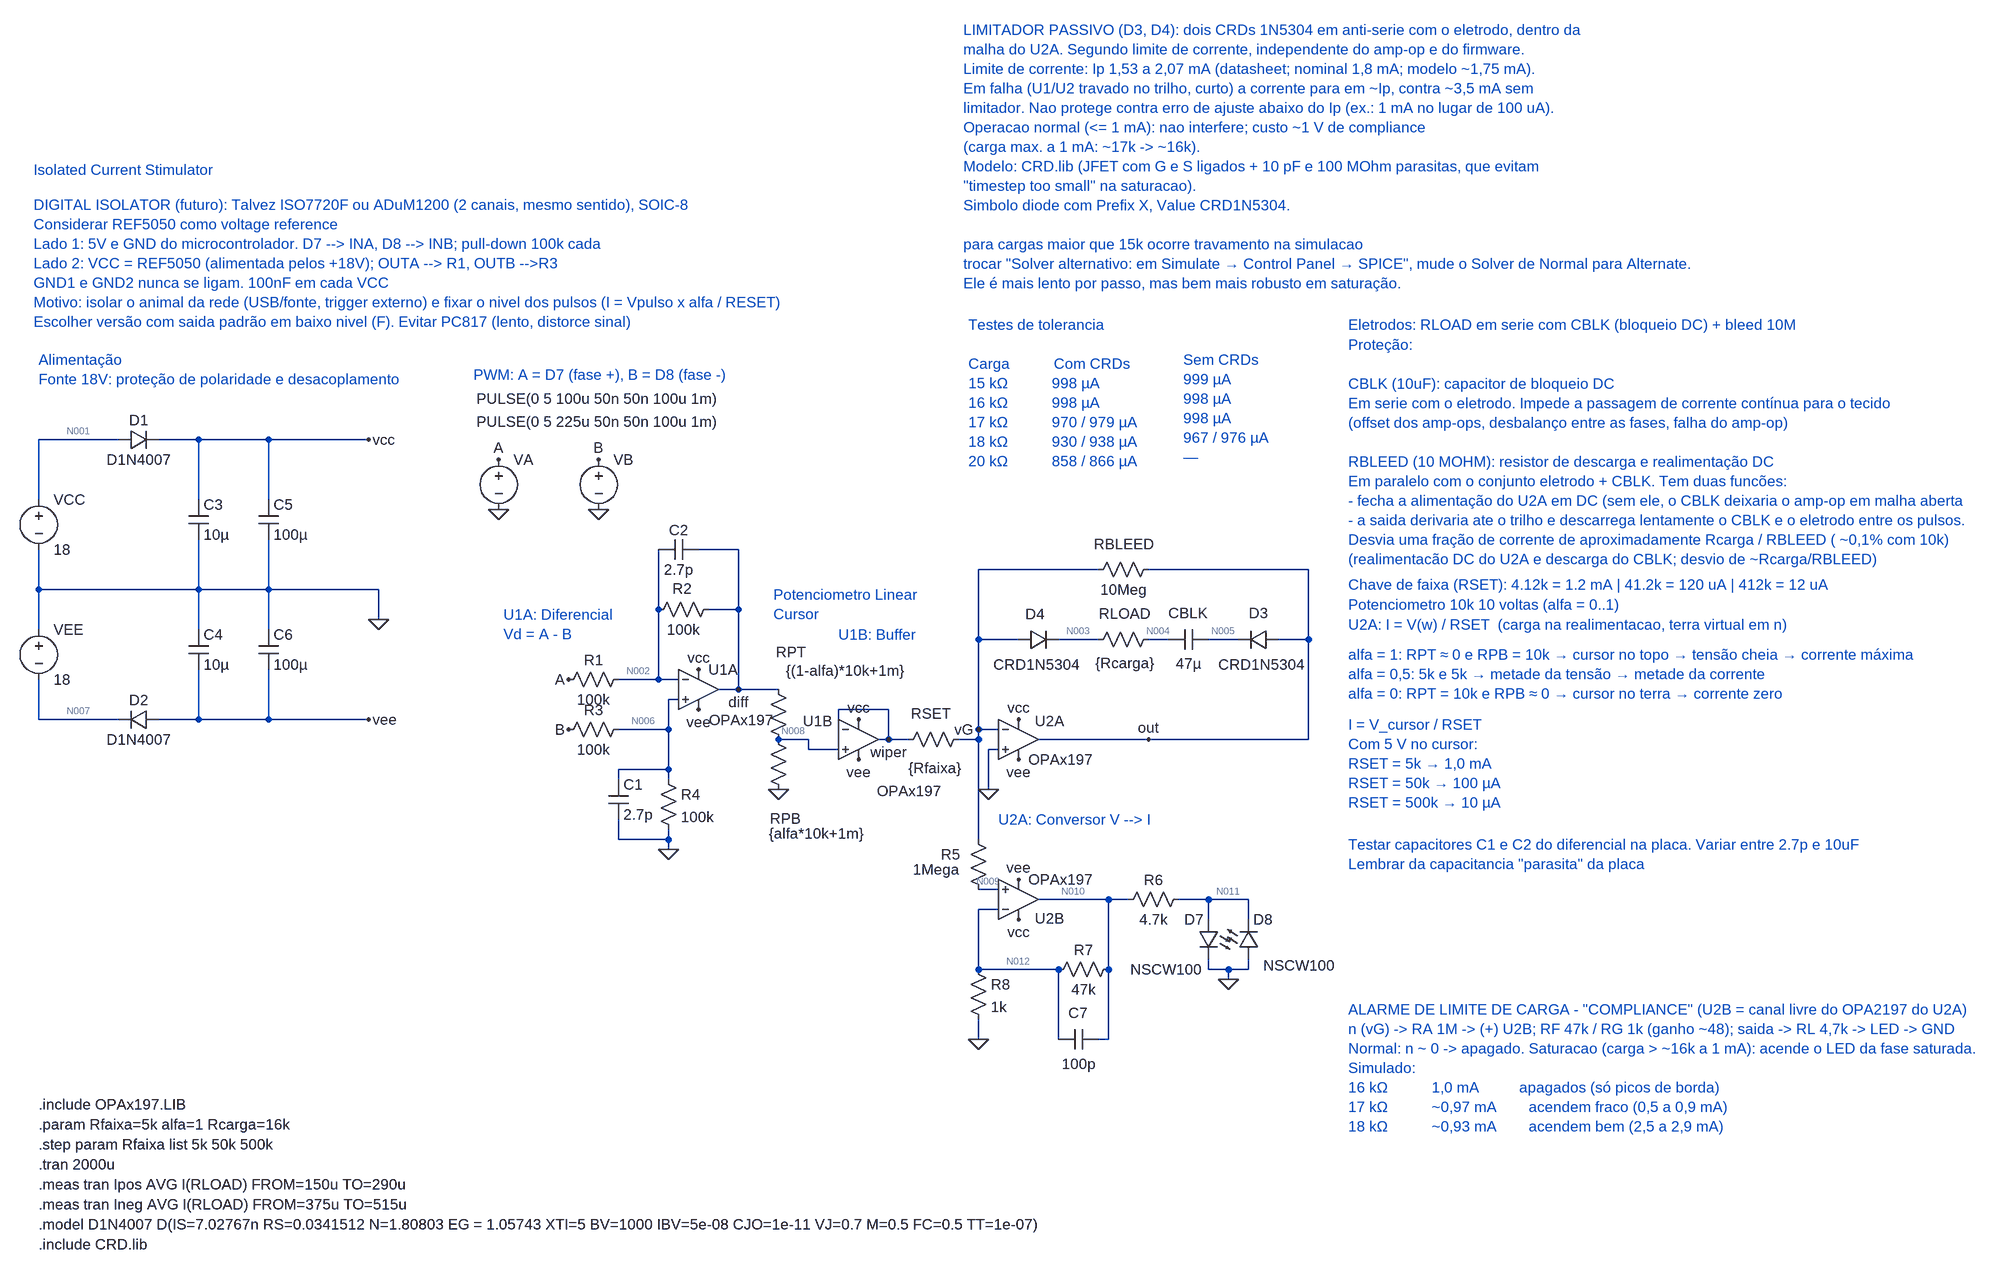
[diagram p0: schematic gila_stim_opax197_limit.asc]
gila_stim_opax197_limit.asc, the LTspice schematic file:
Version 4.1
SHEET 1 3020 1240
WIRE -944 -352 -1072 -352
WIRE -816 -352 -880 -352
WIRE -704 -352 -816 -352
WIRE -544 -352 -704 -352
WIRE -1072 -256 -1072 -352
WIRE -816 -256 -816 -352
WIRE -704 -256 -704 -352
WIRE 48 -176 -16 -176
WIRE 624 -144 432 -144
WIRE 960 -144 704 -144
WIRE -1072 -112 -1072 -176
WIRE -816 -112 -816 -192
WIRE -816 -112 -1072 -112
WIRE -704 -112 -704 -192
WIRE -704 -112 -816 -112
WIRE -528 -112 -704 -112
WIRE -80 -80 -80 -176
WIRE 48 -80 48 -176
WIRE 48 -80 0 -80
WIRE -528 -64 -528 -112
WIRE -1072 -48 -1072 -112
WIRE -816 -48 -816 -112
WIRE -704 -48 -704 -112
WIRE 432 -32 432 -144
WIRE 496 -32 432 -32
WIRE 624 -32 560 -32
WIRE 736 -32 704 -32
WIRE 848 -32 800 -32
WIRE 960 -32 960 -144
WIRE 960 -32 912 -32
WIRE -80 32 -80 -80
WIRE -80 32 -144 32
WIRE -48 32 -80 32
WIRE 48 48 48 -80
WIRE 48 48 16 48
WIRE 112 48 48 48
WIRE -48 64 -64 64
WIRE 288 80 208 80
WIRE -1072 96 -1072 32
WIRE -944 96 -1072 96
WIRE -816 96 -816 16
WIRE -816 96 -880 96
WIRE -704 96 -704 16
WIRE -704 96 -816 96
WIRE -544 96 -704 96
WIRE -64 112 -64 64
WIRE -64 112 -144 112
WIRE 208 112 208 80
WIRE 432 112 432 -32
WIRE 464 112 432 112
WIRE 160 128 112 128
WIRE 288 128 288 80
WIRE 288 128 272 128
WIRE 320 128 288 128
WIRE 432 128 432 112
WIRE 432 128 400 128
WIRE 704 128 528 128
WIRE 960 128 960 -32
WIRE 960 128 704 128
WIRE 160 144 160 128
WIRE 208 144 160 144
WIRE 464 144 448 144
WIRE -64 176 -64 112
WIRE -64 176 -144 176
WIRE -144 192 -144 176
WIRE -64 192 -64 176
WIRE 448 208 448 144
WIRE -144 288 -144 256
WIRE -64 288 -64 272
WIRE -64 288 -144 288
WIRE 432 288 432 128
WIRE -64 304 -64 288
WIRE 464 368 432 368
WIRE 640 384 528 384
WIRE 672 384 640 384
WIRE 800 384 752 384
WIRE 864 384 800 384
WIRE 464 400 432 400
WIRE 800 416 800 384
WIRE 864 416 864 384
WIRE 432 496 432 400
WIRE 560 496 432 496
WIRE 640 496 640 384
WIRE 800 496 800 480
WIRE 832 496 800 496
WIRE 864 496 864 480
WIRE 864 496 832 496
WIRE 832 512 832 496
WIRE 432 608 432 576
WIRE 560 608 560 496
WIRE 640 608 640 496
WIRE 640 608 624 608
FLAG -336 -320 A
FLAG -336 -240 0
FLAG -176 -320 B
FLAG -176 -240 0
FLAG -544 -352 vcc
FLAG -528 -64 0
FLAG -544 96 vee
FLAG -16 16 vcc
FLAG -16 80 vee
FLAG -224 32 A
FLAG -224 112 B
FLAG -64 304 0
FLAG 48 48 diff
FLAG 112 208 0
FLAG 240 96 vcc
FLAG 240 160 vee
FLAG 288 128 wiper
FLAG 496 96 vcc
FLAG 496 160 vee
FLAG 448 208 0
FLAG 432 112 vG
FLAG 704 128 out
FLAG 496 416 vcc
FLAG 496 352 vee
FLAG 832 512 0
FLAG 432 608 0
SYMBOL voltage -336 -336 R0
WINDOW 123 0 0 Left 0
WINDOW 39 0 0 Left 0
WINDOW 3 -35 -82 Left 2
SYMATTR Value PULSE(0 5 100u 50n 50n 100u 1m)
SYMATTR InstName VA
SYMBOL voltage -176 -336 R0
WINDOW 123 0 0 Left 0
WINDOW 39 0 0 Left 0
WINDOW 3 -195 -45 Left 2
SYMATTR Value PULSE(0 5 225u 50n 50n 100u 1m)
SYMATTR InstName VB
SYMBOL voltage -1072 -272 R0
WINDOW 123 0 0 Left 0
WINDOW 39 0 0 Left 0
SYMATTR InstName VCC
SYMATTR Value 18
SYMBOL voltage -1072 -64 R0
WINDOW 123 0 0 Left 0
WINDOW 39 0 0 Left 0
SYMATTR InstName VEE
SYMATTR Value 18
SYMBOL OpAmps\\opamp2 -16 -16 R0
WINDOW 3 17 113 Left 2
SYMATTR Value OPAx197
SYMATTR InstName U1A
SYMBOL res -128 16 R90
WINDOW 0 0 56 VBottom 2
WINDOW 3 32 56 VTop 2
SYMATTR InstName R1
SYMATTR Value 100k
SYMBOL res 16 -96 R90
WINDOW 0 -2 58 VBottom 2
WINDOW 3 32 56 VTop 2
SYMATTR InstName R2
SYMATTR Value 100k
SYMBOL res -128 96 R90
WINDOW 0 0 56 VBottom 2
WINDOW 3 32 56 VTop 2
SYMATTR InstName R3
SYMATTR Value 100k
SYMBOL res -80 176 R0
SYMATTR InstName R4
SYMATTR Value 100k
SYMBOL res 96 32 R0
WINDOW 0 12 -44 Left 2
WINDOW 3 123 -30 Top 2
SYMATTR InstName RPT
SYMATTR Value {(1-alfa)*10k+1m}
SYMBOL res 96 112 R0
WINDOW 0 2 142 Left 2
WINDOW 3 1 166 Left 2
SYMATTR InstName RPB
SYMATTR Value {alfa*10k+1m}
SYMBOL OpAmps\\opamp2 240 64 R0
WINDOW 0 -89 34 Left 2
WINDOW 3 29 146 Left 2
SYMATTR InstName U1B
SYMATTR Value OPAx197
SYMBOL res 416 112 R90
WINDOW 0 -10 60 VBottom 2
WINDOW 3 46 54 VTop 2
SYMATTR InstName RSET
SYMATTR Value {Rfaixa}
SYMATTR SpiceLine tol=1
SYMBOL OpAmps\\opamp2 496 64 R0
WINDOW 0 26 34 Left 2
SYMATTR InstName U2A
SYMATTR Value OPAx197
SYMBOL res 720 -160 R90
WINDOW 0 -9 56 VBottom 2
WINDOW 3 32 56 VTop 2
SYMATTR InstName RBLEED
SYMATTR Value 10Meg
SYMBOL res 720 -48 R90
WINDOW 0 -10 54 VBottom 2
WINDOW 3 38 54 VTop 2
SYMATTR InstName RLOAD
SYMATTR Value {Rcarga}
SYMBOL cap 800 -48 R90
WINDOW 0 -11 33 VBottom 2
WINDOW 3 39 32 VTop 2
SYMATTR InstName CBLK
SYMATTR Value 47µ
SYMBOL cap -160 192 R0
SYMATTR InstName C1
SYMATTR Value 2.7p
SYMBOL cap -80 -160 R270
WINDOW 0 32 32 VTop 2
WINDOW 3 0 32 VBottom 2
SYMATTR InstName C2
SYMATTR Value 2.7p
SYMBOL diode -880 80 R90
WINDOW 0 0 32 VBottom 2
WINDOW 3 32 32 VTop 2
SYMATTR InstName D2
SYMATTR Value D1N4007
SYMBOL diode -944 -336 R270
WINDOW 0 32 32 VTop 2
WINDOW 3 0 32 VBottom 2
SYMATTR InstName D1
SYMATTR Value D1N4007
SYMBOL cap -832 -256 R0
SYMATTR InstName C3
SYMATTR Value 10µ
SYMBOL cap -832 -48 R0
SYMATTR InstName C4
SYMATTR Value 10µ
SYMBOL cap -720 -256 R0
SYMATTR InstName C5
SYMATTR Value 100µ
SYMBOL cap -720 -48 R0
SYMATTR InstName C6
SYMATTR Value 100µ
SYMBOL diode 912 -48 R90
WINDOW 0 -11 32 VBottom 2
WINDOW 3 40 28 VTop 2
SYMATTR InstName D3
SYMATTR Value CRD1N5304
SYMATTR Prefix X
SYMBOL diode 496 -16 R270
WINDOW 0 41 26 VTop 2
WINDOW 3 -8 28 VBottom 2
SYMATTR InstName D4
SYMATTR Value CRD1N5304
SYMATTR Prefix X
SYMBOL OpAmps\\opamp2 496 448 M180
WINDOW 0 26 34 Left 2
SYMATTR InstName U2B
SYMATTR Value OPAx197
SYMBOL res 416 272 R0
WINDOW 0 -44 40 Left 2
WINDOW 3 -89 64 Left 2
SYMATTR InstName R5
SYMATTR Value 1Mega
SYMBOL res 768 368 R90
WINDOW 0 0 56 VBottom 2
WINDOW 3 32 56 VTop 2
SYMATTR InstName R6
SYMATTR Value 4.7k
SYMBOL res 656 480 R90
WINDOW 0 0 56 VBottom 2
WINDOW 3 32 56 VTop 2
SYMATTR InstName R7
SYMATTR Value 47k
SYMBOL res 416 480 R0
SYMATTR InstName R8
SYMATTR Value 1k
SYMBOL LED 816 416 M0
WINDOW 3 -185 73 Left 2
SYMATTR Value NSCW100
SYMATTR InstName D7
SYMBOL LED 848 480 M180
WINDOW 0 24 64 Left 2
WINDOW 3 -173 -16 Left 2
SYMATTR InstName D8
SYMATTR Value NSCW100
SYMBOL cap 624 592 R90
WINDOW 0 -11 33 VBottom 2
WINDOW 3 39 32 VTop 2
SYMATTR InstName C7
SYMATTR Value 100p
TEXT -376 -456 Left 2 ;PWM: A = D7 (fase +), B = D8 (fase -)
TEXT -328 -72 Left 2 ;U1A: Diferencial\nVd = A - B
TEXT 1024 -88 Left 2 ;Potenciometro 10k 10 voltas (alfa = 0..1)
TEXT 1024 -120 Left 2 ;Chave de faixa (RSET): 4.12k = 1.2 mA | 41.2k = 120 uA | 412k = 12 uA
TEXT 1024 -536 Left 2 ;Eletrodos: RLOAD em serie com CBLK (bloqueio DC) + bleed 10M
TEXT 1024 -56 Left 2 ;U2A: I = V(w) / RSET  (carga na realimentacao, terra virtual em n)
TEXT -1072 712 Left 2 !.include OPAx197.LIB
TEXT -1072 744 Left 2 !.param Rfaixa=5k alfa=1 Rcarga=16k
TEXT -1072 776 Left 2 !.step param Rfaixa list 5k 50k 500k
TEXT -1072 808 Left 2 !.tran 2000u
TEXT -1072 840 Left 2 !.meas tran Ipos AVG I(RLOAD) FROM=150u TO=290u
TEXT -1072 872 Left 2 !.meas tran Ineg AVG I(RLOAD) FROM=375u TO=515u
TEXT 1024 -8 Left 2 ;alfa = 1: RPT ≈ 0 e RPB = 10k → cursor no topo → tensão cheia → corrente máxima\nalfa = 0,5: 5k e 5k → metade da tensão → metade da corrente\nalfa = 0: RPT = 10k e RPB ≈ 0 → cursor no terra → corrente zero
TEXT 1024 104 Left 2 ;I = V_cursor / RSET\nCom 5 V no cursor:\nRSET = 5k → 1,0 mA\nRSET = 50k → 100 µA\nRSET = 500k → 10 µA
TEXT 208 -40 Left 2 ;U1B: Buffer
TEXT 104 -104 Left 2 ;Potenciometro Linear\nCursor
TEXT 464 256 Left 2 ;U2A: Conversor V --> I
TEXT 1024 296 Left 2 ;Testar capacitores C1 e C2 do diferencial na placa. Variar entre 2.7p e 10uF\nLembrar da capacitancia "parasita" da placa
TEXT -1072 -480 Left 2 ;Alimentação\nFonte 18V: proteção de polaridade e desacoplamento
TEXT -1072 904 Left 2 !.model D1N4007 D(IS=7.02767n RS=0.0341512 N=1.80803 EG = 1.05743 XTI=5 BV=1000 IBV=5e-08 CJO=1e-11 VJ=0.7 M=0.5 FC=0.5 TT=1e-07)
TEXT -1080 -784 Left 2 ;Isolated Current Stimulator
TEXT -1080 -728 Left 2 ;DIGITAL ISOLATOR (futuro): Talvez ISO7720F ou ADuM1200 (2 canais, mesmo sentido), SOIC-8\nConsiderar REF5050 como voltage reference\nLado 1: 5V e GND do microcontrolador. D7 --> INA, D8 --> INB; pull-down 100k cada\nLado 2: VCC = REF5050 (alimentada pelos +18V); OUTA --> R1, OUTB -->R3\nGND1 e GND2 nunca se ligam. 100nF em cada VCC\nMotivo: isolar o animal da rede (USB/fonte, trigger externo) e fixar o nivel dos pulsos (I = Vpulso x alfa / RESET)\nEscolher versão com saida padrão em baixo nivel (F). Evitar PC817 (lento, distorce sinal)
TEXT 1024 -504 Left 2 ;Proteção:\n \nCBLK (10uF): capacitor de bloqueio DC\nEm serie com o eletrodo. Impede a passagem de corrente contínua para o tecido \n(offset dos amp-ops, desbalanço entre as fases, falha do amp-op)\n \nRBLEED (10 MOHM): resistor de descarga e realimentação DC\nEm paralelo com o conjunto eletrodo + CBLK. Tem duas funcões:\n- fecha a alimentação do U2A em DC (sem ele, o CBLK deixaria o amp-op em malha aberta\n- a saida derivaria ate o trilho e descarrega lentamente o CBLK e o eletrodo entre os pulsos. \nDesvia uma fração de corrente de aproximadamente Rcarga / RBLEED ( ~0,1% com 10k)\n(realimentacão DC do U2A e descarga do CBLK; desvio de ~Rcarga/RBLEED)
TEXT -1072 936 Left 2 !.include CRD.lib
TEXT 416 -536 Left 2 ;Testes de tolerancia\n \nCarga           Com CRDs\n15 kΩ           998 µA\n16 kΩ           998 µA         \n17 kΩ           970 / 979 µA    \n18 kΩ           930 / 938 µA   \n20 kΩ           858 / 866 µA
TEXT 760 -480 Left 2 ;Sem CRDs\n999 µA\n998 µA\n998 µA\n967 / 976 µA\n—
TEXT 408 -1008 Left 2 ;LIMITADOR PASSIVO (D3, D4): dois CRDs 1N5304 em anti-serie com o eletrodo, dentro da\nmalha do U2A. Segundo limite de corrente, independente do amp-op e do firmware.\nLimite de corrente: Ip 1,53 a 2,07 mA (datasheet; nominal 1,8 mA; modelo ~1,75 mA).\nEm falha (U1/U2 travado no trilho, curto) a corrente para em ~Ip, contra ~3,5 mA sem\nlimitador. Nao protege contra erro de ajuste abaixo do Ip (ex.: 1 mA no lugar de 100 uA).\nOperacao normal (<= 1 mA): nao interfere; custo ~1 V de compliance\n(carga max. a 1 mA: ~17k -> ~16k).\nModelo: CRD.lib (JFET com G e S ligados + 10 pF e 100 MOhm parasitas, que evitam\n"timestep too small" na saturacao). \nSimbolo diode com Prefix X, Value CRD1N5304.\n \npara cargas maior que 15k ocorre travamento na simulacao\ntrocar "Solver alternativo: em Simulate → Control Panel → SPICE", mude o Solver de Normal para Alternate. \nEle é mais lento por passo, mas bem mais robusto em saturação.
TEXT 1024 560 Left 2 ;ALARME DE LIMITE DE CARGA - "COMPLIANCE" (U2B = canal livre do OPA2197 do U2A)\nn (vG) -> RA 1M -> (+) U2B; RF 47k / RG 1k (ganho ~48); saida -> RL 4,7k -> LED -> GND\nNormal: n ~ 0 -> apagado. Saturacao (carga > ~16k a 1 mA): acende o LED da fase saturada.\nSimulado: \n16 kΩ           1,0 mA          apagados (só picos de borda)\n17 kΩ           ~0,97 mA        acendem fraco (0,5 a 0,9 mA)\n18 kΩ           ~0,93 mA        acendem bem (2,5 a 2,9 mA)

The netlist it stands for:
* gila_stim_opax197_limit.asc
VA A 0 PULSE(0 5 100u 50n 50n 100u 1m)
VB B 0 PULSE(0 5 225u 50n 50n 100u 1m)
VCC N001 0 18
VEE 0 N007 18
X§U1A N006 N002 vcc vee diff OPAx197  ; pins In+ In- V+ V- OUT
R1 N002 A 100k
R2 diff N002 100k
R3 N006 B 100k
R4 N006 0 100k
RPT diff N008 {(1-alfa)*10k+1m}
RPB N008 0 {alfa*10k+1m}
X§U1B N008 wiper vcc vee wiper OPAx197  ; pins In+ In- V+ V- OUT
RSET vG wiper {Rfaixa} tol=1
X§U2A 0 vG vcc vee out OPAx197  ; pins In+ In- V+ V- OUT
RBLEED out vG 10Meg
RLOAD N004 N003 {Rcarga}
CBLK N005 N004 47µ
C1 N006 0 2.7p
C2 N002 diff 2.7p
D2 vee N007 D1N4007
D1 N001 vcc D1N4007
C3 vcc 0 10µ
C4 0 vee 10µ
C5 vcc 0 100µ
C6 0 vee 100µ
X§D3 out N005 CRD1N5304  ; pins + -
X§D4 vG N003 CRD1N5304  ; pins + -
X§U2B N009 N012 vcc vee N010 OPAx197  ; pins In+ In- V+ V- OUT
R5 vG N009 1Mega
R6 N011 N010 4.7k
R7 N010 N012 47k
R8 N012 0 1k
D7 N011 0 NSCW100
D8 0 N011 NSCW100
C7 N010 N012 100p
.model D D
.lib standard.dio
* PWM: A = D7 (fase +), B = D8 (fase -)
* U1A: Diferencial
* Vd = A - B
* Potenciometro 10k 10 voltas (alfa = 0..1)
* Chave de faixa (RSET): 4.12k = 1.2 mA | 41.2k = 120 uA | 412k = 12 uA
* Eletrodos: RLOAD em serie com CBLK (bloqueio DC) + bleed 10M
* U2A: I = V(w) / RSET  (carga na realimentacao, terra virtual em n)
.include OPAx197.LIB
.param Rfaixa=5k alfa=1 Rcarga=16k
.step param Rfaixa list 5k 50k 500k
.tran 2000u
.meas tran Ipos AVG I(RLOAD) FROM=150u TO=290u
.meas tran Ineg AVG I(RLOAD) FROM=375u TO=515u
* alfa = 1: RPT ≈ 0 e RPB = 10k → cursor no topo → tensão cheia → corrente máxima
* alfa = 0,5: 5k e 5k → metade da tensão → metade da corrente
* alfa = 0: RPT = 10k e RPB ≈ 0 → cursor no terra → corrente zero
* I = V_cursor / RSET
* Com 5 V no cursor:
* RSET = 5k → 1,0 mA
* RSET = 50k → 100 µA
* RSET = 500k → 10 µA
* U1B: Buffer
* Potenciometro Linear
* Cursor
* U2A: Conversor V --> I
* Testar capacitores C1 e C2 do diferencial na placa. Variar entre 2.7p e 10uF
* Lembrar da capacitancia "parasita" da placa
* Alimentação
* Fonte 18V: proteção de polaridade e desacoplamento
.model D1N4007 D(IS=7.02767n RS=0.0341512 N=1.80803 EG = 1.05743 XTI=5 BV=1000 IBV=5e-08 CJO=1e-11 VJ=0.7 M=0.5 FC=0.5 TT=1e-07)
* Isolated Current Stimulator
* DIGITAL ISOLATOR (futuro): Talvez ISO7720F ou ADuM1200 (2 canais, mesmo sentido), SOIC-8
* Considerar REF5050 como voltage reference
* Lado 1: 5V e GND do microcontrolador. D7 --> INA, D8 --> INB; pull-down 100k cada
* Lado 2: VCC = REF5050 (alimentada pelos +18V); OUTA --> R1, OUTB -->R3
* GND1 e GND2 nunca se ligam. 100nF em cada VCC
* Motivo: isolar o animal da rede (USB/fonte, trigger externo) e fixar o nivel dos pulsos (I = Vpulso x alfa / RESET)
* Escolher versão com saida padrão em baixo nivel (F). Evitar PC817 (lento, distorce sinal)
* Proteção:
* CBLK (10uF): capacitor de bloqueio DC
* Em serie com o eletrodo. Impede a passagem de corrente contínua para o tecido
* (offset dos amp-ops, desbalanço entre as fases, falha do amp-op)
* RBLEED (10 MOHM): resistor de descarga e realimentação DC
* Em paralelo com o conjunto eletrodo + CBLK. Tem duas funcões:
* - fecha a alimentação do U2A em DC (sem ele, o CBLK deixaria o amp-op em malha aberta
* - a saida derivaria ate o trilho e descarrega lentamente o CBLK e o eletrodo entre os pulsos.
* Desvia uma fração de corrente de aproximadamente Rcarga / RBLEED ( ~0,1% com 10k)
* (realimentacão DC do U2A e descarga do CBLK; desvio de ~Rcarga/RBLEED)
.include CRD.lib
* Testes de tolerancia
* Carga           Com CRDs
* 15 kΩ           998 µA
* 16 kΩ           998 µA
* 17 kΩ           970 / 979 µA
* 18 kΩ           930 / 938 µA
* 20 kΩ           858 / 866 µA
* Sem CRDs
* 999 µA
* 998 µA
* 998 µA
* 967 / 976 µA
* —
* LIMITADOR PASSIVO (D3, D4): dois CRDs 1N5304 em anti-serie com o eletrodo, dentro da
* malha do U2A. Segundo limite de corrente, independente do amp-op e do firmware.
* Limite de corrente: Ip 1,53 a 2,07 mA (datasheet; nominal 1,8 mA; modelo ~1,75 mA).
* Em falha (U1/U2 travado no trilho, curto) a corrente para em ~Ip, contra ~3,5 mA sem
* limitador. Nao protege contra erro de ajuste abaixo do Ip (ex.: 1 mA no lugar de 100 uA).
* Operacao normal (<= 1 mA): nao interfere; custo ~1 V de compliance
* (carga max. a 1 mA: ~17k -> ~16k).
* Modelo: CRD.lib (JFET com G e S ligados + 10 pF e 100 MOhm parasitas, que evitam
* "timestep too small" na saturacao).
* Simbolo diode com Prefix X, Value CRD1N5304.
* para cargas maior que 15k ocorre travamento na simulacao
* trocar "Solver alternativo: em Simulate → Control Panel → SPICE", mude o Solver de Normal para Alternate.
* Ele é mais lento por passo, mas bem mais robusto em saturação.
* ALARME DE LIMITE DE CARGA - "COMPLIANCE" (U2B = canal livre do OPA2197 do U2A)
* n (vG) -> RA 1M -> (+) U2B; RF 47k / RG 1k (ganho ~48); saida -> RL 4,7k -> LED -> GND
* Normal: n ~ 0 -> apagado. Saturacao (carga > ~16k a 1 mA): acende o LED da fase saturada.
* Simulado:
* 16 kΩ           1,0 mA          apagados (só picos de borda)
* 17 kΩ           ~0,97 mA        acendem fraco (0,5 a 0,9 mA)
* 18 kΩ           ~0,93 mA        acendem bem (2,5 a 2,9 mA)
.backanno
.end

* Results of the author's LTspice run, read from the files saved beside the schematic
* Operating Point (first step), zero values left out:
*   V(diff) = 49.26 µV
*   V(n001) = 18 V
*   V(n002) = 24.48 µV
*   V(n003) = 24.74 µV
*   V(n004) = 24.74 µV
*   V(n005) = -98.38 mV
*   V(n006) = -250.1 nV
*   V(n007) = -18 V
*   V(n008) = 49.26 µV
*   V(n009) = 19.74 µV
*   V(n010) = 2.135 mV
*   V(n011) = 2.133 mV
*   V(n012) = 44.47 µV
*   V(out) = -98.38 mV
*   V(vcc) = 17.38 V
*   V(vee) = -17.38 V
*   V(vg) = 24.74 µV
*   V(wiper) = 73.98 µV
*   I(D1) = 4 mA
*   I(D2) = 4 mA
*   I(D7) = 145.3 pA
*   I(D8) = -144 pA
*   I(R1) = 244.8 pA
*   I(R2) = 247.8 pA
*   I(R3) = -2.501 pA
*   I(R4) = -2.501 pA
*   I(R5) = 5.003 pA
*   I(R6) = -289.3 pA
*   I(R7) = 44.47 nA
*   I(R8) = 44.47 nA
*   I(RBLEED) = -9.84 nA
*   I(RPB) = 4.926 nA
*   I(RPT) = 4.931 nA
*   I(RSET) = -9.848 nA
*   I(VA) = 244.8 pA
*   I(VB) = -2.501 pA
*   I(VCC) = -4 mA
*   I(VEE) = -4 mA
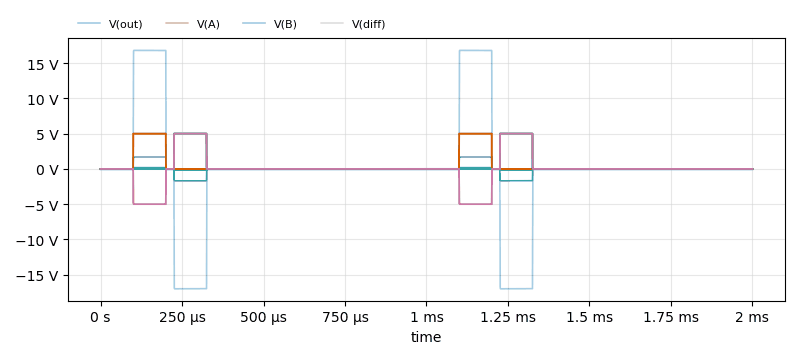
[diagram p1: Transient Analysis of gila_stim_opax197_limit.asc, plotted from the saved traces]
* Transient Analysis, 3 runs:
*   V(out) [rfaixa=5000]: min -16.99 V, max 16.8 V, average -98.16 mV, rms 7.547 V, last -98.38 mV
*   V(out) [rfaixa=50000]: min -1.695 V, max 1.676 V, average -9.72 mV, rms 753.1 mV, last -9.746 mV
*   V(out) [rfaixa=500000]: min -169.9 mV, max 168.1 mV, average -877.7 µV, rms 75.3 mV, last -880.3 µV
*   V(A) [rfaixa=5000]: min 0 V, max 5 V, average 500.2 mV, rms 1.582 V, last 0 V
*   V(A) [rfaixa=50000]: min 0 V, max 5 V, average 500.2 mV, rms 1.582 V, last 0 V
*   V(A) [rfaixa=500000]: min 0 V, max 5 V, average 500.2 mV, rms 1.582 V, last 0 V
*   V(B) [rfaixa=5000]: min 0 V, max 5 V, average 500.2 mV, rms 1.582 V, last 0 V
*   V(B) [rfaixa=50000]: min 0 V, max 5 V, average 500.2 mV, rms 1.582 V, last 0 V
*   V(B) [rfaixa=500000]: min 0 V, max 5 V, average 500.2 mV, rms 1.582 V, last 0 V
*   V(diff) [rfaixa=5000]: min -5 V, max 5 V, average 49.26 µV, rms 2.234 V, last 49.29 µV
*   V(diff) [rfaixa=50000]: min -5 V, max 5 V, average 49.29 µV, rms 2.234 V, last 49.28 µV
*   V(diff) [rfaixa=500000]: min -5 V, max 5 V, average 49.29 µV, rms 2.234 V, last 49.27 µV
* From the log:
*   Measurement: ipos
*     step  AVG(I(RLOAD) )  FROM  TO
*        1  -9.96701058631e-05  0.00015  0.00029
*        2  -1.01647456348e-05  0.00015  0.00029
*        3  -1.01717354087e-06  0.00015  0.00029
*   Measurement: ineg
*     step  AVG(I(RLOAD) )  FROM  TO
*        1  -1.15025756194e-11  0.000375  0.000515
*        2  -8.66661583398e-13  0.000375  0.000515
*        3  9.63784429752e-13  0.000375  0.000515